# EasyEDA Pro project МПА-регистратор.eprj, board PCB2
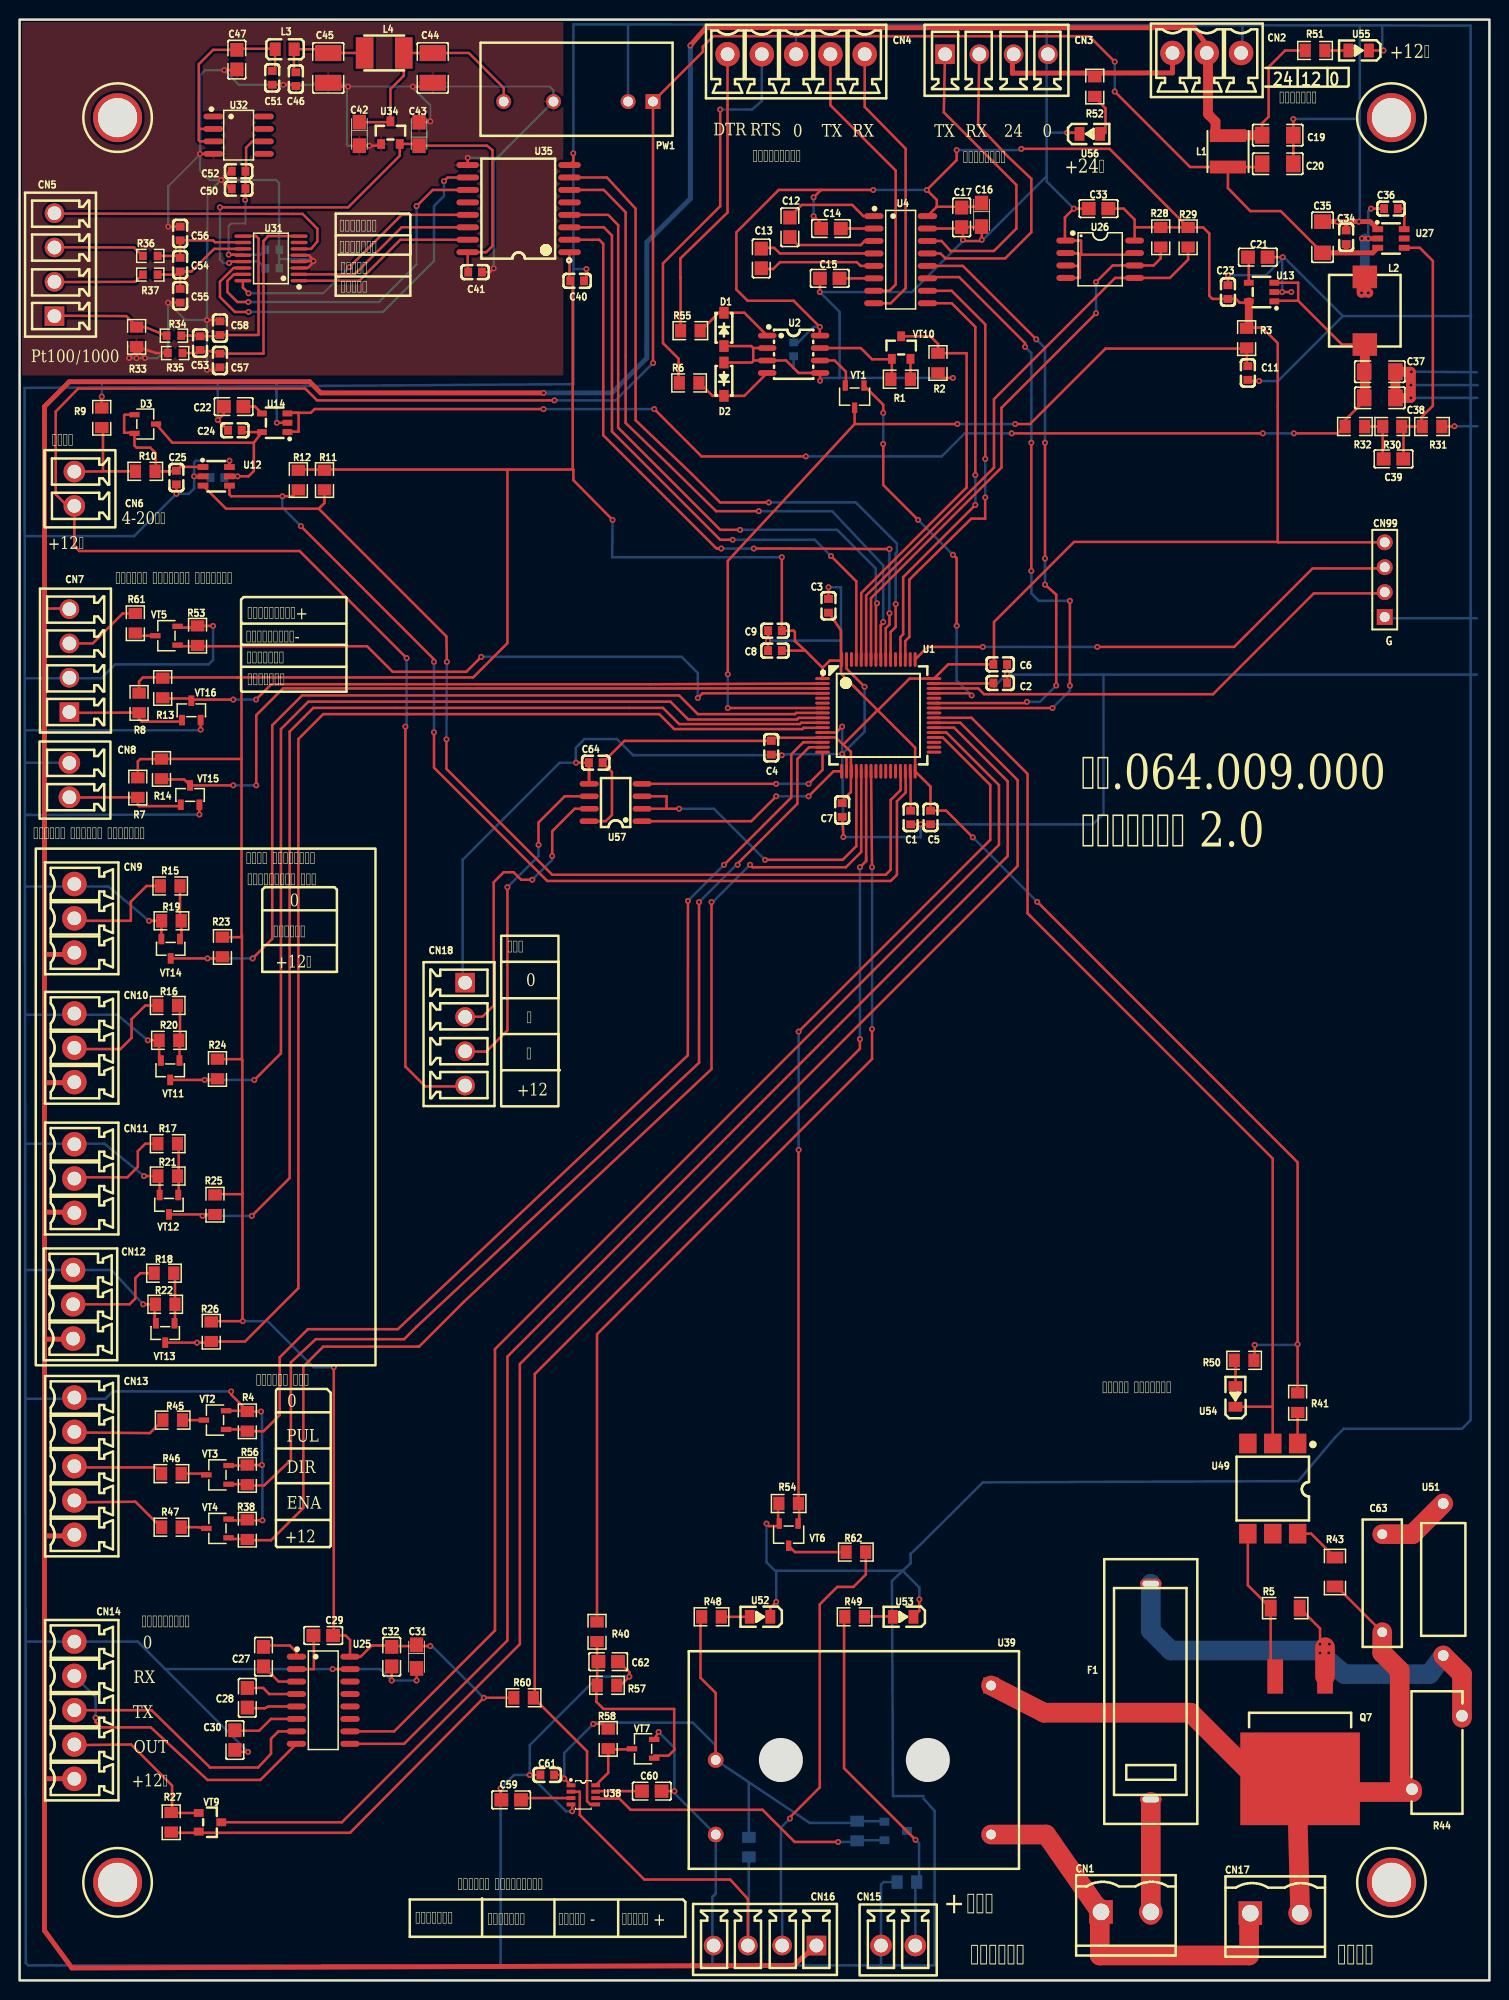
[diagram p6: board, top side]
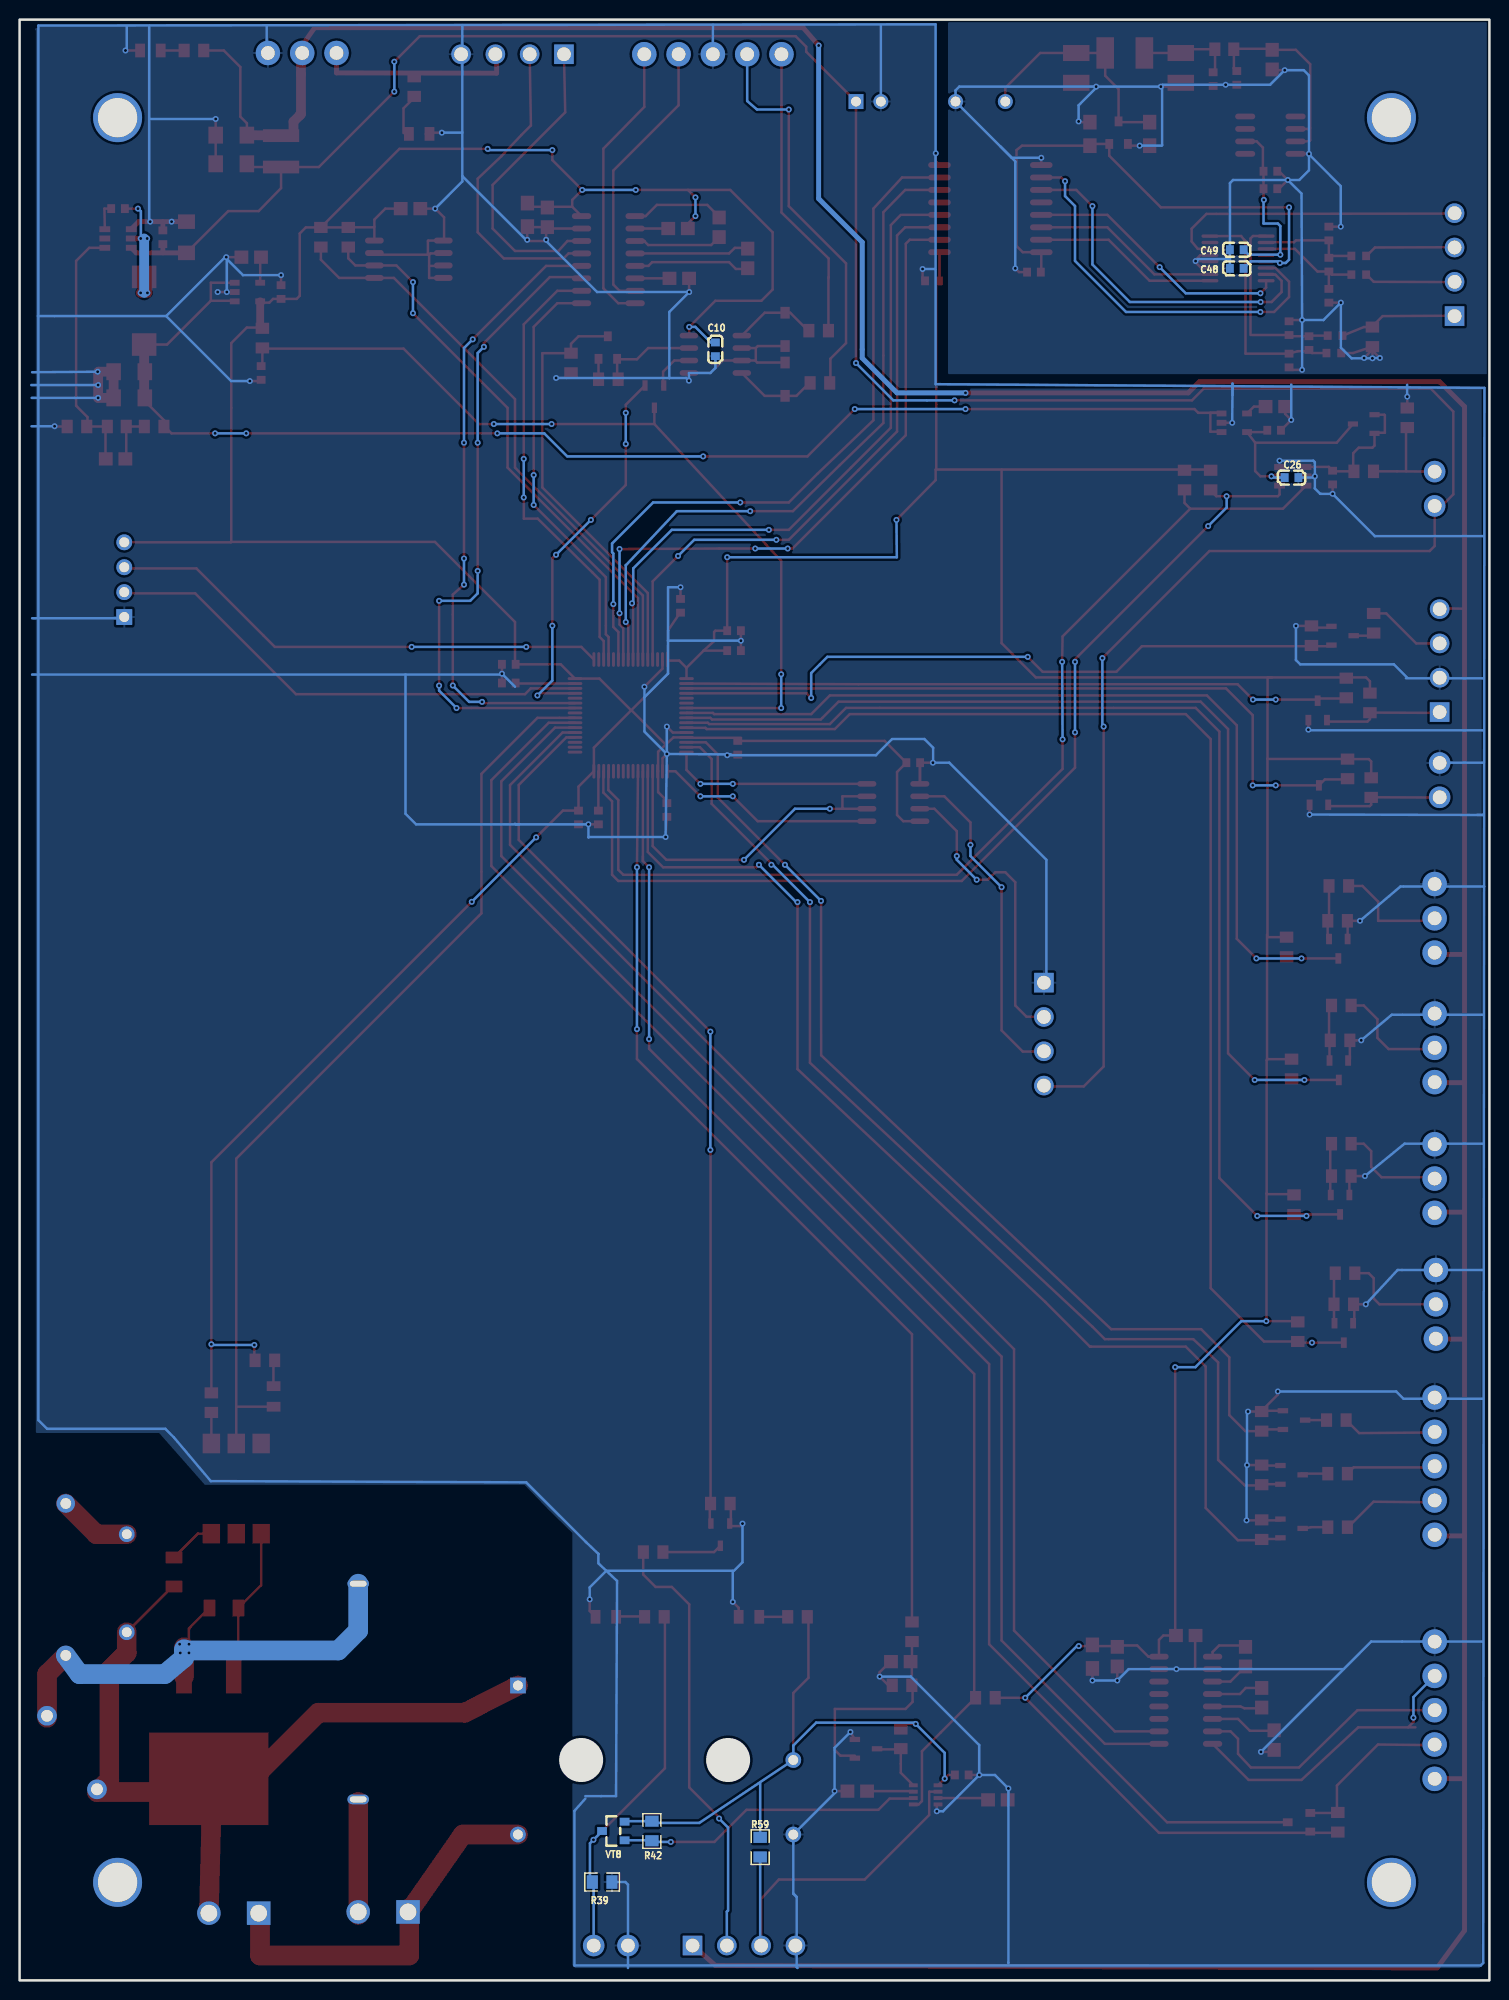
[diagram p7: board, bottom side, seen from below]

Outline 150 x 200 mm; copper layers: Top Layer, Bottom Layer. Coordinates in mm from the lower left corner of the outline.
Outline path: rectangle 0,200 150,0
Stack: Top Layer 0.035mm / Dielectric1 1.51mm FR4 er 4.5 / Bottom Layer 0.035mm

## Design rules (mm)
template: JLCPCB Capability(Two Layers Board)
spacing copperThickness1oz (default): track to track 0.102, other pairs 0.152 to 0.3
spacing copperThickness2oz: track to track 0.203, other pairs 0.152 to 0.3
track width copperThickness1oz (default): min 0.127, default 0.254, max 2.54
track width copperThickness2oz: min 0.203, default 0.254, max 2.54
differential pair differentialPair (default): width min 0.127, default 0.254, max 2.54; gap min 0.152, default 0.152
via viaSize (default): diameter min 0.5, default 0.61, max 10; hole min 0.3, default 0.305, max 6.3

## Placement (name value [footprint] x y rotation side)
C1  2.2uF  [C0603]  90.93 118.62 90 top
C2  2.2uF  [C0603]  100.08 132.33 180 top
C3  100nF  [C0603]  82.55 140.21 270 top
C4  100nF  [C0603]  76.71 125.73 90 top
C5  100nF  [C0603]  92.96 118.62 90 top
C6  100nF  [C0603]  100.08 134.24 180 top
C7  100nF  [C0603]  83.95 119.38 90 top
C8  4.7uF  [C0603]  77.09 135.64 0 top
C9  2.2uF  [C0603]  77.09 137.67 0 top
C10  100nF  [C0603]  78.99 166.37 270 bottom
C11  100nF  [C0603]  125.35 163.96 90 top
C12  100nF  [C0805]  78.61 178.82 90 top
C13  100nF  [C0805]  75.69 175.64 90 top
C14  100nF  [C0805]  82.8 178.69 0 top
C15  100nF  [C0805]  82.68 173.61 0 top
C16  10uF  [CASE-A_3216]  98.17 180.09 270 top
C17  100nF  [C0805]  96.14 179.83 90 top
C19  10uF  [C1206]  128.4 188.21 180 top
C20  10uF  [C1206]  128.4 185.29 180 top
C21  470pF  [C0805]  126.37 175.77 180 top
C22  470pF  [C0805]  21.84 160.53 0 top
C23  4.7uF  [C0603]  123.32 172.21 270 top
C24  4.7uF  [C0603]  21.97 158.12 0 top
C25  2.2uF  [C0603]  16 153.29 90 top
C26  100nF  [C0603]  20.19 153.29 0 bottom
C27  100nF  [C0805]  24.89 33.02 90 top
C28  100nF  [C0805]  23.24 28.83 90 top
C29  100nF  [C0805]  30.99 35.18 180 top
C30  100nF  [C0805]  21.97 24.51 90 top
C31  10uF  [CASE-A_3216]  40.51 33.02 270 top
C32  100nF  [C0805]  37.97 33.02 90 top
C33  100nF  [C0805]  110.11 180.72 180 top
C34  100nF  [C0603]  135.38 177.8 270 top
C35  10uF  [C1206]  132.97 177.8 90 top
C36  100nF  [C0603]  139.95 180.72 0 top
C37  22uF  [C1206]  138.81 164.08 180 top
C38  22uF  [C1206]  138.81 161.42 180 top
C39  75pF  [C0805]  140.21 155.19 180 top
C40  100nF  [C0603]  56.9 173.35 0 top
C41  100nF  [C0603]  46.48 174.24 0 top
C42  10uF  [CASE-A_3216]  34.67 188.34 270 top
C43  10uF  [CASE-A_3216]  40.77 188.34 90 top
C44  10uF  [C1210]  42.16 195.07 90 top
C45  10uF  [C1210]  31.5 195.07 90 top
C46  100nF  [C0603]  28.19 193.93 90 top
C47  1uF  [C0805]  22.17 195.92 90 top
C48  100nF  [C0603]  25.78 174.62 180 bottom
C49  100nF  [C0603]  25.78 176.53 180 bottom
C50  100nF  [C0603]  22.35 182.75 0 top
C51  100nF  [C0603]  25.78 194.06 90 top
C52  2.2uF  [C0603]  22.35 184.53 0 top
C53  100nF  [C0603]  18.42 167 90 top
C54  100nF  [C0603]  16.38 175.01 90 top
C55  10nF  [C0603]  16.38 171.83 90 top
C56  10nF  [C0603]  16.38 178.18 90 top
C57  10nF  [C0603]  20.45 165.23 90 top
C58  10nF  [C0603]  20.45 168.53 90 top
C59  22nF  [C0805]  50.17 18.41 0 top
C60  680nF  [C0805]  64.52 19.3 0 top
C61  100nF  [C0603]  53.85 20.96 180 top
C62  470nF  [C0805]  60.07 32.51 180 top
C63  -  [CAP-TH_L13.0-W4.0-P10.00-D1.0]  139.06 40.51 270 top
C64  100nF  [C0603]  58.8 124.21 0 top
CN1  2EDGV-5.08-02P-14-100A(H)  [CONN-TH_P5.08_2EDGV-5.08-02P-14-100A-H]  112.9 6.99 0 top
CN2  MX15EDGVC-3.5-03P-GN01-Cu-A  [CONN-TH_3P-P3.50_MX15EDGV-3.5-GN01-03P-CU-A]  121.16 196.6 0 top
CN3  15EDGVC-3.5-04P-14-00A(H)  [CONN-TH_4P-P3.50_TOPONELEC_15ETYVC-3.5-04P-14-00AH]  99.69 196.47 0 top
CN4  MX15EDGVC-3.5-05P-GN01-Cu-A  [CONN-TH_5P-P3.50_MX15EDGV-3.5-GN01-05P-CU-A]  79.25 196.47 0 top
CN5  15EDGVC-3.5-04P-14-00A(H)  [CONN-TH_4P-P3.50_TOPONELEC_15ETYVC-3.5-04P-14-00AH]  3.56 175.01 90 top
CN6  15EDGVC-3.5-02P-14-00A(H)  [CONN-TH_2P-P3.50_15EDGVC-3.5-02P-14-00AH]  5.59 152.15 90 top
CN7  15EDGVC-3.5-04P-14-00A(H)  [CONN-TH_4P-P3.50_TOPONELEC_15ETYVC-3.5-04P-14-00AH]  5.08 134.62 90 top
CN8  15EDGVC-3.5-02P-14-00A(H)  [CONN-TH_2P-P3.50_15EDGVC-3.5-02P-14-00AH]  5.08 122.43 90 top
CN9  MX15EDGVC-3.5-03P-GN01-Cu-A  [CONN-TH_3P-P3.50_MX15EDGV-3.5-GN01-03P-CU-A]  5.59 108.33 90 top
CN10  MX15EDGVC-3.5-03P-GN01-Cu-A  [CONN-TH_3P-P3.50_MX15EDGV-3.5-GN01-03P-CU-A]  5.59 95.12 90 top
CN11  MX15EDGVC-3.5-03P-GN01-Cu-A  [CONN-TH_3P-P3.50_MX15EDGV-3.5-GN01-03P-CU-A]  5.59 81.79 90 top
CN12  MX15EDGVC-3.5-03P-GN01-Cu-A  [CONN-TH_3P-P3.50_MX15EDGV-3.5-GN01-03P-CU-A]  5.46 68.96 90 top
CN13  MX15EDGVC-3.5-05P-GN01-Cu-A  [CONN-TH_5P-P3.50_MX15EDGV-3.5-GN01-05P-CU-A]  5.59 52.45 90 top
CN14  MX15EDGVC-3.5-05P-GN01-Cu-A  [CONN-TH_5P-P3.50_MX15EDGV-3.5-GN01-05P-CU-A]  5.59 27.56 90 top
CN15  15EDGVC-3.5-02P-14-00A(H)  [CONN-TH_2P-P3.50_15EDGVC-3.5-02P-14-00AH]  89.66 3.56 180 top
CN16  15EDGVC-3.5-04P-14-00A(H)  [CONN-TH_4P-P3.50_TOPONELEC_15ETYVC-3.5-04P-14-00AH]  76.07 3.56 180 top
CN17  2EDGV-5.08-02P-14-100A(H)  [CONN-TH_P5.08_2EDGV-5.08-02P-14-100A-H]  128.14 6.86 0 top
CN18  15EDGVC-3.5-04P-14-00A(H)  [CONN-TH_4P-P3.50_TOPONELEC_15ETYVC-3.5-04P-14-00AH]  45.47 96.52 270 top
CN99  HDR-M_2.54_1x4P  [HDR-TH_HDR-M_2.54_1X4P]  139.32 142.88 90 top
D1  MBR0530T1G  [SOD-123_L2.7-W1.6-LS3.7-RD-1]  71.88 168.4 270 top
D2  MBR0530T1G  [SOD-123_L2.7-W1.6-LS3.7-RD-1]  71.88 163.32 90 top
D3  BAT54C  [SOT-23-3_L3.0-W1.7-P0.95-LS2.9-BR]  12.83 158.75 180 top
F1  5x20 BLX-A型 保险丝支架 XC-7  [FUSE-TH_L22.6-W9.0]  115.44 29.46 90 top
L1  10uH  [IND-SMD_L4.0-W4.0_SMNR4012]  123.32 186.56 270 top
L2  CDSPRH74-150M  [IND-SMD_L7.3-W7.3]  137.29 170.31 270 top
L3  ACMS201209A6012A  [L0805]  27.05 196.98 180 top
L4  22uH  [IND-SMD_L4.5-W3.2]  37.21 196.6 180 top
NOREF  -  [Pad_e178]  140 190 0 top
NOREF#2  -  [Pad_e171]  10 10 0 top
NOREF#3  -  [Pad_e177]  10 190 0 top
NOREF#4  -  [Pad_e176]  140 10 0 top
PW1  70kHz  [PWRM-TH_JETEKPS_HXXXXS-1W_1]  57.02 191.64 180 top
Q7  BTA216B-600E,118  [D2PAK_L10.2-W9.0-P5.08-LS15.9-BR]  130.68 25.78 90 top
R1  10K  [R0805]  89.92 163.32 0 top
R2  10K  [R0805]  93.73 164.97 90 top
R3  10K  [R0805]  125.22 167.51 90 top
R4  10kΩ  [R0805]  23.24 57.02 270 top
R5  360Ω  [R1206]  129.16 37.97 0 top
R6  1.5kΩ  [R0805]  68.33 162.94 0 top
R7  10kΩ  [R0805]  12.06 121.67 90 top
R8  10kΩ  [R0805]  12.19 130.3 90 top
R9  100Ω  [R0805]  8.38 159.38 270 top
R10  1kΩ  [R0805]  12.83 153.92 180 top
R11  5.1kΩ  [R0805]  31.11 153.03 270 top
R12  5.1kΩ  [R0805]  28.45 153.03 270 top
R13  10kΩ  [R0805]  14.61 131.83 90 top
R14  10kΩ  [R0805]  14.48 123.57 90 top
R15  39kΩ  [R0805]  15.37 111.63 180 top
R16  39kΩ  [R0805]  15.11 99.44 180 top
R17  39kΩ  [R0805]  15.11 85.34 180 top
R18  39kΩ  [R0805]  14.73 72.14 180 top
R19  10kΩ  [R0805]  15.49 108.08 0 top
R20  10kΩ  [R0805]  15.24 95.89 0 top
R21  10kΩ  [R0805]  15.11 82.04 0 top
R22  10kΩ  [R0805]  14.86 68.96 0 top
R23  10kΩ  [R0805]  20.7 105.41 90 top
R24  10kΩ  [R0805]  20.19 92.96 90 top
R25  10kΩ  [R0805]  19.94 79.12 90 top
R26  10kΩ  [R0805]  19.56 66.17 90 top
R27  10kΩ  [R0805]  15.47 16.13 270 top
R28  5.1kΩ  [R0805]  116.46 177.8 90 top
R29  5.1kΩ  [R0805]  119.25 177.8 90 top
R30  100kΩ  [R0805_NEW]  140.08 158.5 180 top
R31  13.3kΩ  [R0805]  144.15 158.5 180 top
R32  49.9Ω  [R0805]  136.27 158.5 180 top
R33  10kΩ  [R0805]  11.94 167.64 90 top
R34  1kΩ  [R0603]  15.75 167.77 0 top
R35  1kΩ  [R0603]  15.88 165.99 0 top
R36  1kΩ  [R0603]  13.33 175.9 0 top
R37  1kΩ  [R0603]  13.33 173.99 0 top
R38  10kΩ  [R0805]  23.24 45.97 270 top
R39  1kΩ  [R0805]  90.55 10.03 0 bottom
R40  2.2kΩ  [R0805]  58.93 35.56 90 top
R41  240Ω  [R0805]  130.43 58.93 90 top
R42  10K  [R0805]  85.47 15.24 90 bottom
R43  360Ω  [R1206]  134.24 41.66 270 top
R44  220pF@1kHz  [RES-TH_L12.5-W5.1-P7.50-D0.9-S5.10]  144.65 23.24 270 top
R45  1kΩ  [R0805]  15.62 57.15 0 top
R46  1kΩ  [R0805]  15.49 51.69 0 top
R47  1kΩ  [R0805]  15.49 46.23 0 top
R48  1.5kΩ  [R0805]  70.61 37.08 180 top
R49  1.5kΩ  [R0805]  85.22 37.08 180 top
R50  240Ω  [R0805]  124.97 63.25 0 top
R51  6.8kΩ  [R0805]  132.21 196.85 180 top
R52  15kΩ  [R0805]  109.73 193.17 90 top
R53  10kΩ  [R0805]  18.16 137.16 270 top
R54  10kΩ  [R0805]  78.49 48.64 0 top
R55  1.5kΩ  [R0805]  68.45 168.28 0 top
R56  10kΩ  [R0805]  23.24 51.56 270 top
R57  10K  [R0805]  59.94 30.1 180 top
R58  10K  [R0805]  60.07 24.64 90 top
R59  10K  [R0805]  74.42 13.59 90 bottom
R60  10K  [R0805]  51.44 28.83 0 top
R61  1kΩ  [R0805]  11.81 138.43 90 top
R62  1kΩ  [R0805]  85.34 43.69 0 top
U1  STM32F415RGT6  [LQFP-64_L10.0-W10.0-P0.50-LS12.0-BL]  87.63 129.03 270 top
U2  HCPL-063L-500E  [SO-8_L4.9-W3.9-P1.27-LS5.9-BL]  78.99 165.86 270 top
U4  ADM3202ARNZ-REEL7  [SOIC-16_L9.9-W3.9-P1.27-LS6.0-BL]  89.92 175.51 270 top
U12  ADS1110A4IDBVT  [SOT-23-6_L2.9-W1.6-P0.95-LS2.8-BR]  20.07 153.42 180 top
U13  LDK130M33R  [SOT-23-5_L3.0-W1.6-P0.95-LS2.8-BL]  126.75 172.21 90 top
U14  LDK130M33R  [SOT-23-5_L3.0-W1.6-P0.95-LS2.8-BL]  26.03 158.88 90 top
U25  ADM3202ARNZ-REEL7  [SOIC-16_L9.9-W3.9-P1.27-LS6.0-BL]  30.99 28.57 270 top
U26  24LC256-I/SM  [SOIJ-8_L5.3-W5.3-P1.27-LS7.9-BL]  110.28 175.56 270 top
U27  TPS54202DDCT  [SOT-23-6_L2.9-W1.6-P0.95-LS2.8-BR]  139.95 177.67 180 top
U31  ADS1220IPW  [TSSOP-16_L5.0-W4.4-P0.65-LS6.4-BL]  25.65 175.64 90 top
U32  REF195FS REEL  [SOIC-8_L4.9-W3.9-P1.27-LS6.0-BL]  22.35 188.21 270 top
U34  MCP1702T-5002E/CB  [SOT-23_L2.9-W1.3-P1.90-LS2.4-BR]  37.85 188.47 270 top
U35  ISO6762FDWR  [SOIC-16_L10.3-W7.5-P1.27-LS10.3-TL]  50.93 180.72 180 top
U38  LTC2954ITS8-2#TRMPBF  [TSOT-23-8_L2.9-W1.6-P0.65-LS2.8-BL]  57.53 18.92 270 top
U39  IRM-01-5  [PWRM-TH_L33.7-W22.2_IRM-01-12]  85.09 22.48 180 top
U49  MOC3063S  [SMD-6_L7.3-W6.5-P2.54-LS10.0-BL]  127.89 50.16 180 top
U51  39Ω  [RES-TH_BD4.5-L11.5-P15.50-D0.7]  145.29 40.89 90 top
U52  GCX-C0805UGC  [LED0805-R-RD_GREEN]  75.56 37.08 180 top
U53  GCX-C0805UGC  [LED0805-R-RD_GREEN]  90.17 37.08 180 top
U54  GCX-C0805UGC  [LED0805-R-RD_GREEN]  124.08 59.56 90 top
U55  GCX-C0805UGC  [LED0805-R-RD_GREEN]  136.65 196.85 180 top
U56  GCX-C0805UGC  [LED0805-R-RD_GREEN]  109.22 188.34 0 top
U57  SP3485EN-L/TR  [SOIC-8_L5.0-W4.0-P1.27-LS6.0-BL]  60.83 120.14 90 top
VT1  2N7002  [SOT-23-3_L2.9-W1.4-P1.91-LS2.6-BR]  85.22 161.54 90 top
VT2  2N7002  [SOT-23-3_L2.9-W1.4-P1.91-LS2.6-BR]  19.94 57.15 0 top
VT3  2N7002  [SOT-23-3_L2.9-W1.4-P1.91-LS2.6-BR]  20.19 51.56 0 top
VT4  2N7002  [SOT-23-3_L2.9-W1.4-P1.91-LS2.6-BR]  20.19 46.1 0 top
VT5  2N7002  [SOT-23-3_L2.9-W1.4-P1.91-LS2.6-BR]  14.99 137.16 0 top
VT6  2N7002  [SOT-23-3_L2.9-W1.4-P1.91-LS2.6-BR]  78.49 45.47 90 top
VT7  2N7002  [SOT-23-3_L2.9-W1.4-P1.91-LS2.6-BR]  63.63 23.62 0 top
VT8  BSS84  [SOT-23_L2.9-W1.3-P1.90-LS2.4-BR]  89.41 15.24 180 bottom
VT9  BSS84  [SOT-23_L2.9-W1.3-P1.90-LS2.4-BR]  19.43 16.13 180 top
VT10  BSS84  [SOT-23_L2.9-W1.3-P1.90-LS2.4-BR]  89.97 166.55 270 top
VT11  BC847  [SOT-23-3_L2.9-W1.3-P1.90-LS2.3-BR-1]  15.37 92.84 90 top
VT12  BC847  [SOT-23-3_L2.9-W1.3-P1.90-LS2.3-BR-1]  15.24 79.12 90 top
VT13  BC847  [SOT-23-3_L2.9-W1.3-P1.90-LS2.3-BR-1]  14.86 66.04 90 top
VT14  BC847  [SOT-23-3_L2.9-W1.3-P1.90-LS2.3-BR-1]  15.42 105.23 90 top
VT15  BC847  [SOT-23-3_L2.9-W1.3-P1.90-LS2.3-BR-1]  17.4 120.9 270 top
VT16  BC847  [SOT-23-3_L2.9-W1.3-P1.90-LS2.3-BR-1]  17.53 129.54 270 top

## Footprints (pads in the part's own frame, mm; a bottom-side part is the same pattern mirrored in y, then rotated)
C0603
  rect 0.8x0.9 smd: 1(-0.7,0) 2(0.7,0)
C0805
  rect 1.41x1.35 smd: 1(-1,0) 2(1,0)
C1206
  rect 1.485x1.728 smd: 1(-1.593,0) 2(1.593,0)
C1210
  rect 1.635x2.7 smd: 1(-1.518,0) 2(1.518,0)
CAP-TH_L13.0-W4.0-P10.00-D1.0
  round 1.6 hole 1: 1(-5,0) 2(5,0)
CASE-A_3216
  rect 1.5x1.359 smd: 1(-1.2,0) 2(1.2,0)
CONN-TH_2P-P3.50_15EDGVC-3.5-02P-14-00AH
  round 2.2 hole 1.4: 1(-1.75,0) 2(1.75,0)
CONN-TH_3P-P3.50_MX15EDGV-3.5-GN01-03P-CU-A
  round 2.5 hole 1.4: 1(-3.5,0) 2(0,0) 3(3.5,0)
CONN-TH_4P-P3.50_TOPONELEC_15ETYVC-3.5-04P-14-00AH
  rect 2x2 hole 1.4: 1(-5.25,0)
  round 2 hole 1.4: 2(-1.75,0) 3(1.75,0) 4(5.25,0)
CONN-TH_5P-P3.50_MX15EDGV-3.5-GN01-05P-CU-A
  round 2.5 hole 1.4: 1(-7,0) 2(-3.5,0) 3(0,0) 4(3.5,0) 5(7,0)
CONN-TH_P5.08_2EDGV-5.08-02P-14-100A-H
  rect 2.4x2.4 hole 1.7: 1(-2.54,0)
  round 2.4 hole 1.7: 2(2.54,0)
D2PAK_L10.2-W9.0-P5.08-LS15.9-BR
  rect 3.5x1.6 smd: 1(5.222,-2.54) 3(5.222,2.54)
  rect 9.45x12.2 smd: 2(-5.222,0)
FUSE-TH_L22.6-W9.0
  oval 1x2.2 hole 0.6x1.7: 1(-11,0) 2(11,0)
HDR-TH_HDR-M_2.54_1X4P
  rect 1.62x1.62 hole 1.02: 1(-3.81,0)
  round 1.62 hole 1.02: 2(-1.27,0) 3(1.27,0) 4(3.81,0)
IND-SMD_L4.0-W4.0_SMNR4012
  rect 1.3x3.7 smd: 1(-1.6,0) 2(1.6,0)
IND-SMD_L4.5-W3.2
  rect 1.8x3.2 smd: 1(-2,0) 2(2,0)
IND-SMD_L7.3-W7.3
  rect 2.3x2.5 smd: 1(-3.45,0) 2(3.45,0)
L0805
  rect 1.133x1.377 smd: 1(-0.966,0) 2(0.966,0)
LED0805-R-RD_GREEN
  rect 1x1.399 smd: 1(1.05,0) 2(-1.05,0)
LQFP-64_L10.0-W10.0-P0.50-LS12.0-BL
  oval 0.3x1.5 smd: 1(-3.75,-5.688) 2(-3.25,-5.688) 3(-2.75,-5.688) 4(-2.25,-5.688) 5(-1.75,-5.688) 6(-1.25,-5.688) 7(-0.75,-5.688) 8(-0.25,-5.688) 9(0.25,-5.688) 10(0.75,-5.688) 11(1.25,-5.688) 12(1.75,-5.688) 13(2.25,-5.688) 14(2.75,-5.688) 15(3.25,-5.688) 16(3.75,-5.688) 33(3.75,5.688) 34(3.25,5.688) 35(2.75,5.688) 36(2.25,5.688) 37(1.75,5.688) 38(1.25,5.688) 39(0.75,5.688) 40(0.25,5.688) 41(-0.25,5.688) 42(-0.75,5.688) 43(-1.25,5.688) 44(-1.75,5.688) 45(-2.25,5.688) 46(-2.75,5.688) 47(-3.25,5.688) 48(-3.75,5.688)
  oval 1.5x0.3 smd: 17(5.7,-3.738) 18(5.7,-3.238) 19(5.7,-2.738) 20(5.7,-2.238) 21(5.7,-1.738) 22(5.7,-1.238) 23(5.7,-0.739) 24(5.7,-0.238) 25(5.7,0.262) 26(5.7,0.762) 27(5.7,1.262) 28(5.7,1.762) 29(5.7,2.261) 30(5.7,2.762) 31(5.7,3.261) 32(5.7,3.762) 49(-5.7,3.762) 50(-5.7,3.261) 51(-5.7,2.762) 52(-5.7,2.261) 53(-5.7,1.762) 54(-5.7,1.262) 55(-5.7,0.762) 56(-5.7,0.262) 57(-5.7,-0.238) 58(-5.7,-0.739) 59(-5.7,-1.238) 60(-5.7,-1.738) 61(-5.7,-2.238) 62(-5.7,-2.738) 63(-5.7,-3.238) 64(-5.7,-3.738)
Pad_e171
  round 5 hole 4: 1(0,0)
Pad_e176
  round 5 hole 4: 1(0,0)
Pad_e177
  round 5 hole 4: 1(0,0)
Pad_e178
  round 5 hole 4: 1(0,0)
PWRM-TH_JETEKPS_HXXXXS-1W_1
  rect 1.524x1.524 hole 1: 1(-7.62,0)
  round 1.524 hole 1: 2(-5.08,0) 5(2.54,0) 7(7.62,0)
PWRM-TH_L33.7-W22.2_IRM-01-12
  rect 1.6x1.6 hole 1: 1(-14.05,-7.6)
  round 1.6 hole 1: 12(14.05,0) 13(14.05,7.6) 24(-14.05,7.6)
R0603
  rect 0.806x0.864 smd: 1(-0.753,0) 2(0.753,0)
R0805
  rect 1.133x1.377 smd: 1(-1,0) 2(1,0)
R0805_NEW
  rect 1.133x1.377 smd: 1(-0.966,0) 2(0.966,0)
R1206
  rect 1.208x1.701 smd: 1(-1.479,0) 2(1.479,0)
RES-TH_BD4.5-L11.5-P15.50-D0.7
  round 1.879 hole 1.1: 1(-7.75,0) 2(7.75,0)
RES-TH_L12.5-W5.1-P7.50-D0.9-S5.10
  round 2 hole 1.2: 1(-3.75,2.55) 2(3.75,-2.55)
SMD-6_L7.3-W6.5-P2.54-LS10.0-BL
  rect 1.78x2 smd: 1(-2.54,-4.6) 2(0,-4.6) 3(2.54,-4.6) 4(2.54,4.6) 5(0,4.6) 6(-2.54,4.6)
SO-8_L4.9-W3.9-P1.27-LS5.9-BL
  oval 0.574x1.888 smd: 1(-1.905,-2.699) 2(-0.635,-2.699) 3(0.635,-2.699) 4(1.905,-2.699) 5(1.905,2.699) 6(0.635,2.699) 7(-0.635,2.699) 8(-1.905,2.699)
SOD-123_L2.7-W1.6-LS3.7-RD-1
  rect 1.2x0.95 smd: 1(-1.7,0) 2(1.7,0)
SOIC-8_L4.9-W3.9-P1.27-LS6.0-BL
  oval 0.588x2.045 smd: 1(-1.905,-2.57) 2(-0.635,-2.57) 3(0.635,-2.57) 4(1.905,-2.57) 5(1.905,2.57) 6(0.635,2.57) 7(-0.635,2.57) 8(-1.905,2.57)
SOIC-8_L5.0-W4.0-P1.27-LS6.0-BL
  oval 0.569x1.95 smd: 1(-1.905,-2.705) 2(-0.635,-2.705) 3(0.635,-2.705) 4(1.905,-2.705) 5(1.905,2.705) 6(0.635,2.705) 7(-0.635,2.705) 8(-1.905,2.705)
SOIC-16_L9.9-W3.9-P1.27-LS6.0-BL
  oval 0.602x1.971 smd: 1(-4.445,-2.736) 2(-3.175,-2.736) 3(-1.905,-2.736) 4(-0.635,-2.736) 5(0.635,-2.736) 6(1.905,-2.736) 7(3.175,-2.736) 8(4.445,-2.736) 9(4.445,2.736) 10(3.175,2.736) 11(1.905,2.736) 12(0.635,2.736) 13(-0.635,2.736) 14(-1.905,2.736) 15(-3.175,2.736) 16(-4.445,2.736)
SOIC-16_L10.3-W7.5-P1.27-LS10.3-TL
  oval 2.3x0.6 smd: 1(-5.194,4.445) 2(-5.194,3.175) 3(-5.194,1.905) 4(-5.194,0.635) 5(-5.194,-0.635) 6(-5.194,-1.905) 7(-5.194,-3.175) 8(-5.194,-4.445) 9(5.194,-4.445) 10(5.194,-3.175) 11(5.194,-1.905) 12(5.194,-0.635) 13(5.194,0.635) 14(5.194,1.905) 15(5.194,3.175) 16(5.194,4.445)
SOIJ-8_L5.3-W5.3-P1.27-LS7.9-BL
  oval 0.609x1.907 smd: 1(-1.905,-3.515) 2(-0.635,-3.515) 3(0.635,-3.515) 4(1.905,-3.515) 5(1.905,3.515) 6(0.635,3.515) 7(-0.635,3.515) 8(-1.905,3.515)
SOT-23-3_L2.9-W1.3-P1.90-LS2.3-BR-1
  rect 1.07x0.6 smd: 1(0.99,-0.95) 2(0.99,0.95) 3(-0.99,0)
SOT-23-3_L2.9-W1.4-P1.91-LS2.6-BR
  rect 1.07x0.532 smd: 1(1.135,-0.955) 2(1.135,0.955) 3(-1.135,0)
SOT-23-3_L3.0-W1.7-P0.95-LS2.9-BR
  rect 1.038x0.532 smd: 1(1.101,-0.95) 2(1.101,0.95) 3(-1.101,0)
SOT-23-5_L3.0-W1.6-P0.95-LS2.8-BL
  rect 0.6x1 smd: 1(-0.95,-1.3) 2(0,-1.3) 3(0.95,-1.3) 4(0.95,1.3) 5(-0.95,1.3)
SOT-23-6_L2.9-W1.6-P0.95-LS2.8-BR
  rect 1.1x0.6 smd: 1(1.35,-0.95) 2(1.35,0) 3(1.35,0.95) 4(-1.35,0.95) 5(-1.35,0) 6(-1.35,-0.95)
SOT-23_L2.9-W1.3-P1.90-LS2.4-BR
  rect 1x0.8 smd: 1(1.15,-0.95) 2(1.15,0.95) 3(-1.15,0)
TSOT-23-8_L2.9-W1.6-P0.65-LS2.8-BL
  rect 0.4x0.9 smd: 1(-0.975,-1.26) 2(-0.325,-1.26) 3(0.325,-1.26) 4(0.975,-1.26) 5(0.975,1.26) 6(0.325,1.26) 7(-0.325,1.26) 8(-0.975,1.26)
TSSOP-16_L5.0-W4.4-P0.65-LS6.4-BL
  oval 0.343x1.732 smd: 1(-2.275,-2.866) 2(-1.625,-2.866) 3(-0.975,-2.866) 4(-0.325,-2.866) 5(0.325,-2.866) 6(0.975,-2.866) 7(1.625,-2.866) 8(2.275,-2.866) 9(2.275,2.866) 10(1.625,2.866) 11(0.975,2.866) 12(0.325,2.866) 13(-0.325,2.866) 14(-0.975,2.866) 15(-1.625,2.866) 16(-2.275,2.866)

## Nets
As in the schematic, except:
V3: C3.2 C4.2 C5.2 C6.2 C7.2 C8.2 C9.2 C10.1 C14.1 C16.1 C17.2 C23.2 C29.1 C31.1 C32.2 C33.1 C40.1 C64.2 CN99.4 R3.2 R7.2 R8.2 R11.1 R12.1 R13.2 R14.2 R23.2 R24.2 R25.2 R26.2 R27.2 R28.2 R29.2 R41.2 R50.2 R60.1 U1.1 U1.13 U1.19 U1.32 U1.48 U1.64 U2.8 U4.16 U13.5 U25.16 U26.8 U35.1 U57.8 VT9.2
$1N2569: R1.2 VT10.2

Pads without a net: NOREF 1; NOREF#2 1; NOREF#3 1; NOREF#4 1; U1 5 6 24 25 26 27 28 33 34 35 41 44 50 53 62; U25 11 12 13 14; U27 5; U31 7; U32 1 5 7 8; U35 5 12; U49 3 5

## Via types
v1: diameter 0.61, hole 0.305, Top Layer to Bottom Layer, 221 vias

## Routing (per net, layer and track width the routed paths; a pad name or vN(x,y) marks a point on that pad's centre or on a via; arc(x,y) is an arc through that point)
GND: length 36.5
  Top Layer w0.254: v1(56.5,186.36) 56.5,185.55 U35.8 ; v1(106.91,188.47) 108.42,188.47 108.55,188.34
  Bottom Layer w0.254: CN18.1 45.21,102.02 45.21,114.3 55.12,124.21 v1(56.79,124.21) ; 77.09,41.78 76.22,42.65 v1(76.22,46.59)
  vias: v1(8.38,161.54) v1(12.61,68.96) v1(12.7,82.04) v1(13.08,95.89) v1(13.21,108.08) v1(16,151.63) v1(17.81,153.42) v1(18.35,118.92) v1(18.48,127.57) v1(19.74,138.16) v1(20.22,159.16) v1(21.42,155.01) v1(21.59,60.07) v1(23.31,23.31) v1(24.64,58.02) v1(24.74,52.56) v1(24.78,46.92) v1(26.25,158.88) v1(31.94,31.75) v1(37.97,30.59) v1(40.51,30.59) v1(49.09,19.58) v1(52.05,20.96) v1(56.4,17.25) v1(57.85,174.56) v1(62.23,30.99) v1(65.21,25.34) v1(66.83,19.3) v1(76.39,136.65) v1(77.22,38.61) v1(77.78,124.97) v1(81.66,172.21) v1(81.69,163.17) v1(82.55,142.1) v1(83.95,127.89) v1(83.95,125.09) v1(84.07,116.62) v1(86.23,131.95) v1(91.82,38.86) v1(91.95,117.92) v1(95.25,163.45) v1(96.27,177.54) v1(98.2,177.54) v1(100.78,133.29) v1(107.59,180.72) v1(123.32,173.93) v1(126.5,163.13) v1(128.91,175.77) v1(128.85,172.21) v1(129.79,172.21) v1(129.99,189.86) v1(134.49,179.39) v1(136.67,179.39) v1(139.19,196.85) v1(142.04,164.08) v1(141.99,162.72) v1(141.99,161.42) v1(146.43,158.52)
GNDPT: length 14.3
  Top Layer w0.254: v1(19.12,164.27) 20.07,164.27
  Bottom Layer w0.254: v1(33.53,193.17) 33.34,193.36 v1(26.92,193.36) 22.38,193.36 v1(20.89,194.84)
  vias: v1(11.18,165.48) v1(11.94,165.45) v1(12.79,165.48) v1(15.17,178.88) v1(15.16,171.13) v1(18.42,186.31) v1(19.11,169.36) v1(20.57,183.64) v1(29.99,175.37) v1(35.69,187.14) v1(40.13,193.17) v1(41.92,189.62) v1(45.73,185.91) v1(48.39,174.62)
V3: length 2.5
  Bottom Layer w0.254: v1(22.77,67.24) 25.27,67.24
  vias: v1(32.07,62.55) v1(41.91,34.1) v1(47.37,28.83) v1(60.51,148.97) v1(77.79,145.16) v1(81.03,181.86) v1(81.03,179.96) v1(81.66,168.66) v1(87.12,182.63) v1(92.58,182.63) v1(95.63,186.69) v1(97.28,116.59) v1(102.24,186.82) v1(103.85,110.01) v1(126.04,64.81) v1(130.43,64.88)
V3A:
  vias: v1(22.25,153.42)
V5:
  vias: v1(53.47,160.27) v1(64.77,160.27) v1(80.24,155.45) v1(101.25,157.8) v1(126.87,157.8) v1(130.05,157.8)
V5APT:
  vias: v1(21.34,176.02) v1(23.02,181.61)
V5PT:
  vias: v1(20.45,180.85) v1(21.38,175.17)
V5STB:
  vias: v1(55.59,20.58) v1(58.55,26.16)
V12:
  vias: v1(53.47,161.93) v1(68.45,197.36)
V12F: length 91.4
  Top Layer w0.254: CN18.4 45.38,91.19 41.4,91.19 39.37,93.22 v1(39.37,127.89) ; v1(39.5,134.87) 28.58,145.8 6.1,145.8 5.59,146.3 CN6.1
  Bottom Layer w0.254: v1(39.37,127.89) 39.5,128.02 v1(39.5,134.87)
  vias: v1(54.59,161.16) v1(64.64,164.97) v1(111.76,195.71) v1(111.76,192.66)
APM_A: length 34
  Top Layer w0.254: U57.6 55.63,120.78 52.96,118.11 v1(52.96,115.82) ; v1(49.78,111.51) 49.78,96.9 47.62,94.74 45.49,94.74 CN18.3
  Bottom Layer w0.254: v1(49.78,111.51) 52.96,114.68 v1(52.96,115.82)
APM_B: length 31.2
  Top Layer w0.254: 58.13,119.51 56.64,119.51 54.36,117.22 v1(54.36,114.68) ; v1(52.32,112.27) 51.18,112.27 50.42,113.03 49.4,113.03 48.39,112.01 48.39,99.44 47.24,98.3 45.49,98.3 CN18.2
  Bottom Layer w0.254: v1(52.32,112.27) 54.36,114.3 v1(54.36,114.68)
APM_DE: length 29.8
  Top Layer w0.254: v1(67.31,119.51) 65.91,119.51 ; U1.20 85.39,115.7 84,114.3 v1(76.07,114.3)
  Bottom Layer w0.254: v1(67.31,119.51) 70.87,119.51 v1(76.07,114.3)
APM_RX: length 22.5
  Top Layer w0.254: v1(77.22,120.78) 74.68,118.24 U57.1 ; v1(80.52,120.78) 83.07,123.33 U1.17
  Bottom Layer w0.254: v1(80.52,120.78) v1(77.22,120.78)
APM_TX: length 20.8
  Top Layer w0.254: v1(80.52,122.05) 81.94,123.47 U1.16 ; v1(77.22,122.05) U57.4
  Bottom Layer w0.254: v1(80.52,122.05) v1(77.22,122.05)
AUTO:
  vias: v1(21.81,130.64) v1(24.13,130.64)
BTNLED: length 31.4
  Top Layer w0.254: R62.2 86.36,43.67 86.36,41.4 85.09,40.13 83.44,40.13 81.66,38.35 81.66,19.69 78.61,16.64 v1(78.61,16.51)
BTNLEDSIGNAL: length 36.1
  Top Layer w0.254: v1(79.5,84.71) 79.49,84.69 R54.2
  vias: v1(79.5,96.77)
BTNPRESS:
  vias: v1(85.76,113.54) v1(85.76,96.01)
CSPT:
  vias: v1(72.77,146.94) v1(82.8,145.29)
DINPT:
  vias: v1(73.53,147.95) v1(87.5,140.46)
DINPTI:
  vias: v1(23.37,172.09) v1(33.66,174.75)
DIR:
  vias: v1(69.34,109.98) v1(73.28,113.79)
DOUTPT:
  vias: v1(75.44,149.86) v1(88.14,138.56)
DOUTPTI:
  vias: v1(23.35,171.2) v1(40.51,180.97)
DRDYPT:
  vias: v1(76.45,150.75) v1(89.41,140.38)
DRDYPTI:
  vias: v1(23.37,170.18) v1(43.31,183.51)
ENAB: length 20.3
  Top Layer w0.254: v1(74.55,113.79) 74.8,113.54 84.33,113.54 85.89,115.1 U1.21
  vias: v1(70.61,109.98)
KILLSIG:
  vias: v1(87,113.54) v1(87,97.03)
MOTORLED: length 8
  Top Layer w0.254: R61.2 10.53,139.43 7.47,136.37 CN7.3
MOTORLEDSIGNAL:
  vias: v1(47.12,135) v1(69.22,130.81)
NRST:
  vias: v1(72.28,133.22) v1(72.28,129.78) v1(95.71,158.75) v1(101.6,158.75)
NRST_E:
  vias: v1(88.14,159.89) v1(88.14,156.72) v1(91.69,148.97) v1(95.25,145.42) v1(95.63,138.18) v1(97.16,131.06)
PCRTS:
  vias: v1(71.5,190.83)
POSITION0:
  vias: v1(19.18,104.24) v1(23.78,104.24)
POSITION1:
  vias: v1(18.88,91.85) v1(23.95,91.85)
POSITION2:
  vias: v1(18.67,77.98) v1(23.69,77.98)
POSITION3: length 11.1
  Top Layer w0.254: R26.1 23,65.17 28.45,70.61
  vias: v1(18.11,65.05)
PWREN:
  vias: v1(83.54,14.12)
RELAY:
  vias: v1(91.44,14.34)
RX3:
  vias: v1(97.54,153.54) v1(97.54,150.5)
RXLASEROUT:
  vias: v1(7.76,26.8)
RXVAC:
  vias: v1(102.8,130.41) v1(103.76,167.39) v1(104.65,156.84) v1(104.65,145.03) v1(104.65,142.37) v1(105.79,132.08)
SCL420:
  vias: v1(43.6,134.49) v1(43.56,126.59)
SCLFLASH:
  vias: v1(109.85,173.23) v1(109.85,170.05)
SCLPT:
  vias: v1(71.61,146.05) v1(74.93,146.05) v1(88.77,146) v1(88.77,139.45)
SDA420:
  vias: v1(26.82,151.38) v1(28.7,148.34) v1(42.29,134.49) v1(42.29,127.3)
STEP:
  vias: v1(68.21,110.11) v1(71.89,113.79)
SW1:
  vias: v1(136.98,177.67) v1(136.95,172.13) v1(137.64,177.67) v1(137.65,172.13) v1(137.92,180.72)
SWCLK:
  vias: v1(98.3,136.02) v1(109.99,136.02)
TX3:
  vias: v1(98.55,155.19) v1(98.55,151.26)
TXVAC:
  vias: v1(102.62,166.62) v1(103.25,156.84) v1(103.25,143.76) v1(105.41,129.78) v1(107.19,140.72) v1(107.19,132.07)
VENTBTN:
  vias: v1(21.81,121.89) v1(24.16,121.89)
$3N22150: length 2.2
  Top Layer w0.254: R61.1 12.08,137.16 VT5.3
$3N22166: length 6.1
  Top Layer w0.254: VT6.3 79.13,43.69 R62.1
$5N9639:
  vias: v1(132.72,34.29) v1(132.72,33.4) v1(133.6,33.4) v1(133.67,34.29)

## Copper pours and planes (outline as drawn; the poured copper is in the pictures)
GND on Bottom Layer: 148.08,199.14 147.7,199.52 56.52,199.52 56.52,163.06 56.64,162.94 56.07,162.37 0.79,162.37 0.79,1.81 0.64,1.65 1.03,1.26 93.3,1.26 93.6,1.56 93.6,45.65 96.01,48.01 98.47,50.55 131.09,50.55 135.75,55.83 148.34,55.83 148.34,198.88 148.46,199.01 148.34,199.14
GNDPT on Top Layer: -0.51,200.53 55.5,200.53 55.5,163.7 -0.51,163.7
GNDPT on Bottom Layer: -0.38,200.15 55.25,200.15 55.25,163.83 -0.38,163.83

## Text on the board
Top Silkscreen Layer: G | 24 12 0 | Pt100/1000 | Кнопка сброса вакуума | +12В | Вход | Кнопка запуска привода | 4-20мА | TX | RX | OUT | Дальномер | 0 | Подсветка- | Блок датчиков | Контакт | Подсветка+ | положения ИПС | Привод ИПС | Сигнал | +12 | PUL | DIR | ENA | Красный | Белый | Кнопка включения | АПМ | А | В | Подсв - | Подсв + | DTR | RTS | Компьютер | Баратрон | 24 | Сброс вакуума | Питание | +24В | + | ТТР | Клапан | Сеть | АП.064.009.000 / ревизия 2.0
